# Altium schematic sheet Radar_Sheet1.SchDoc
size 420 x 297 mm; SheetNumber: 4; SheetTotal: 6
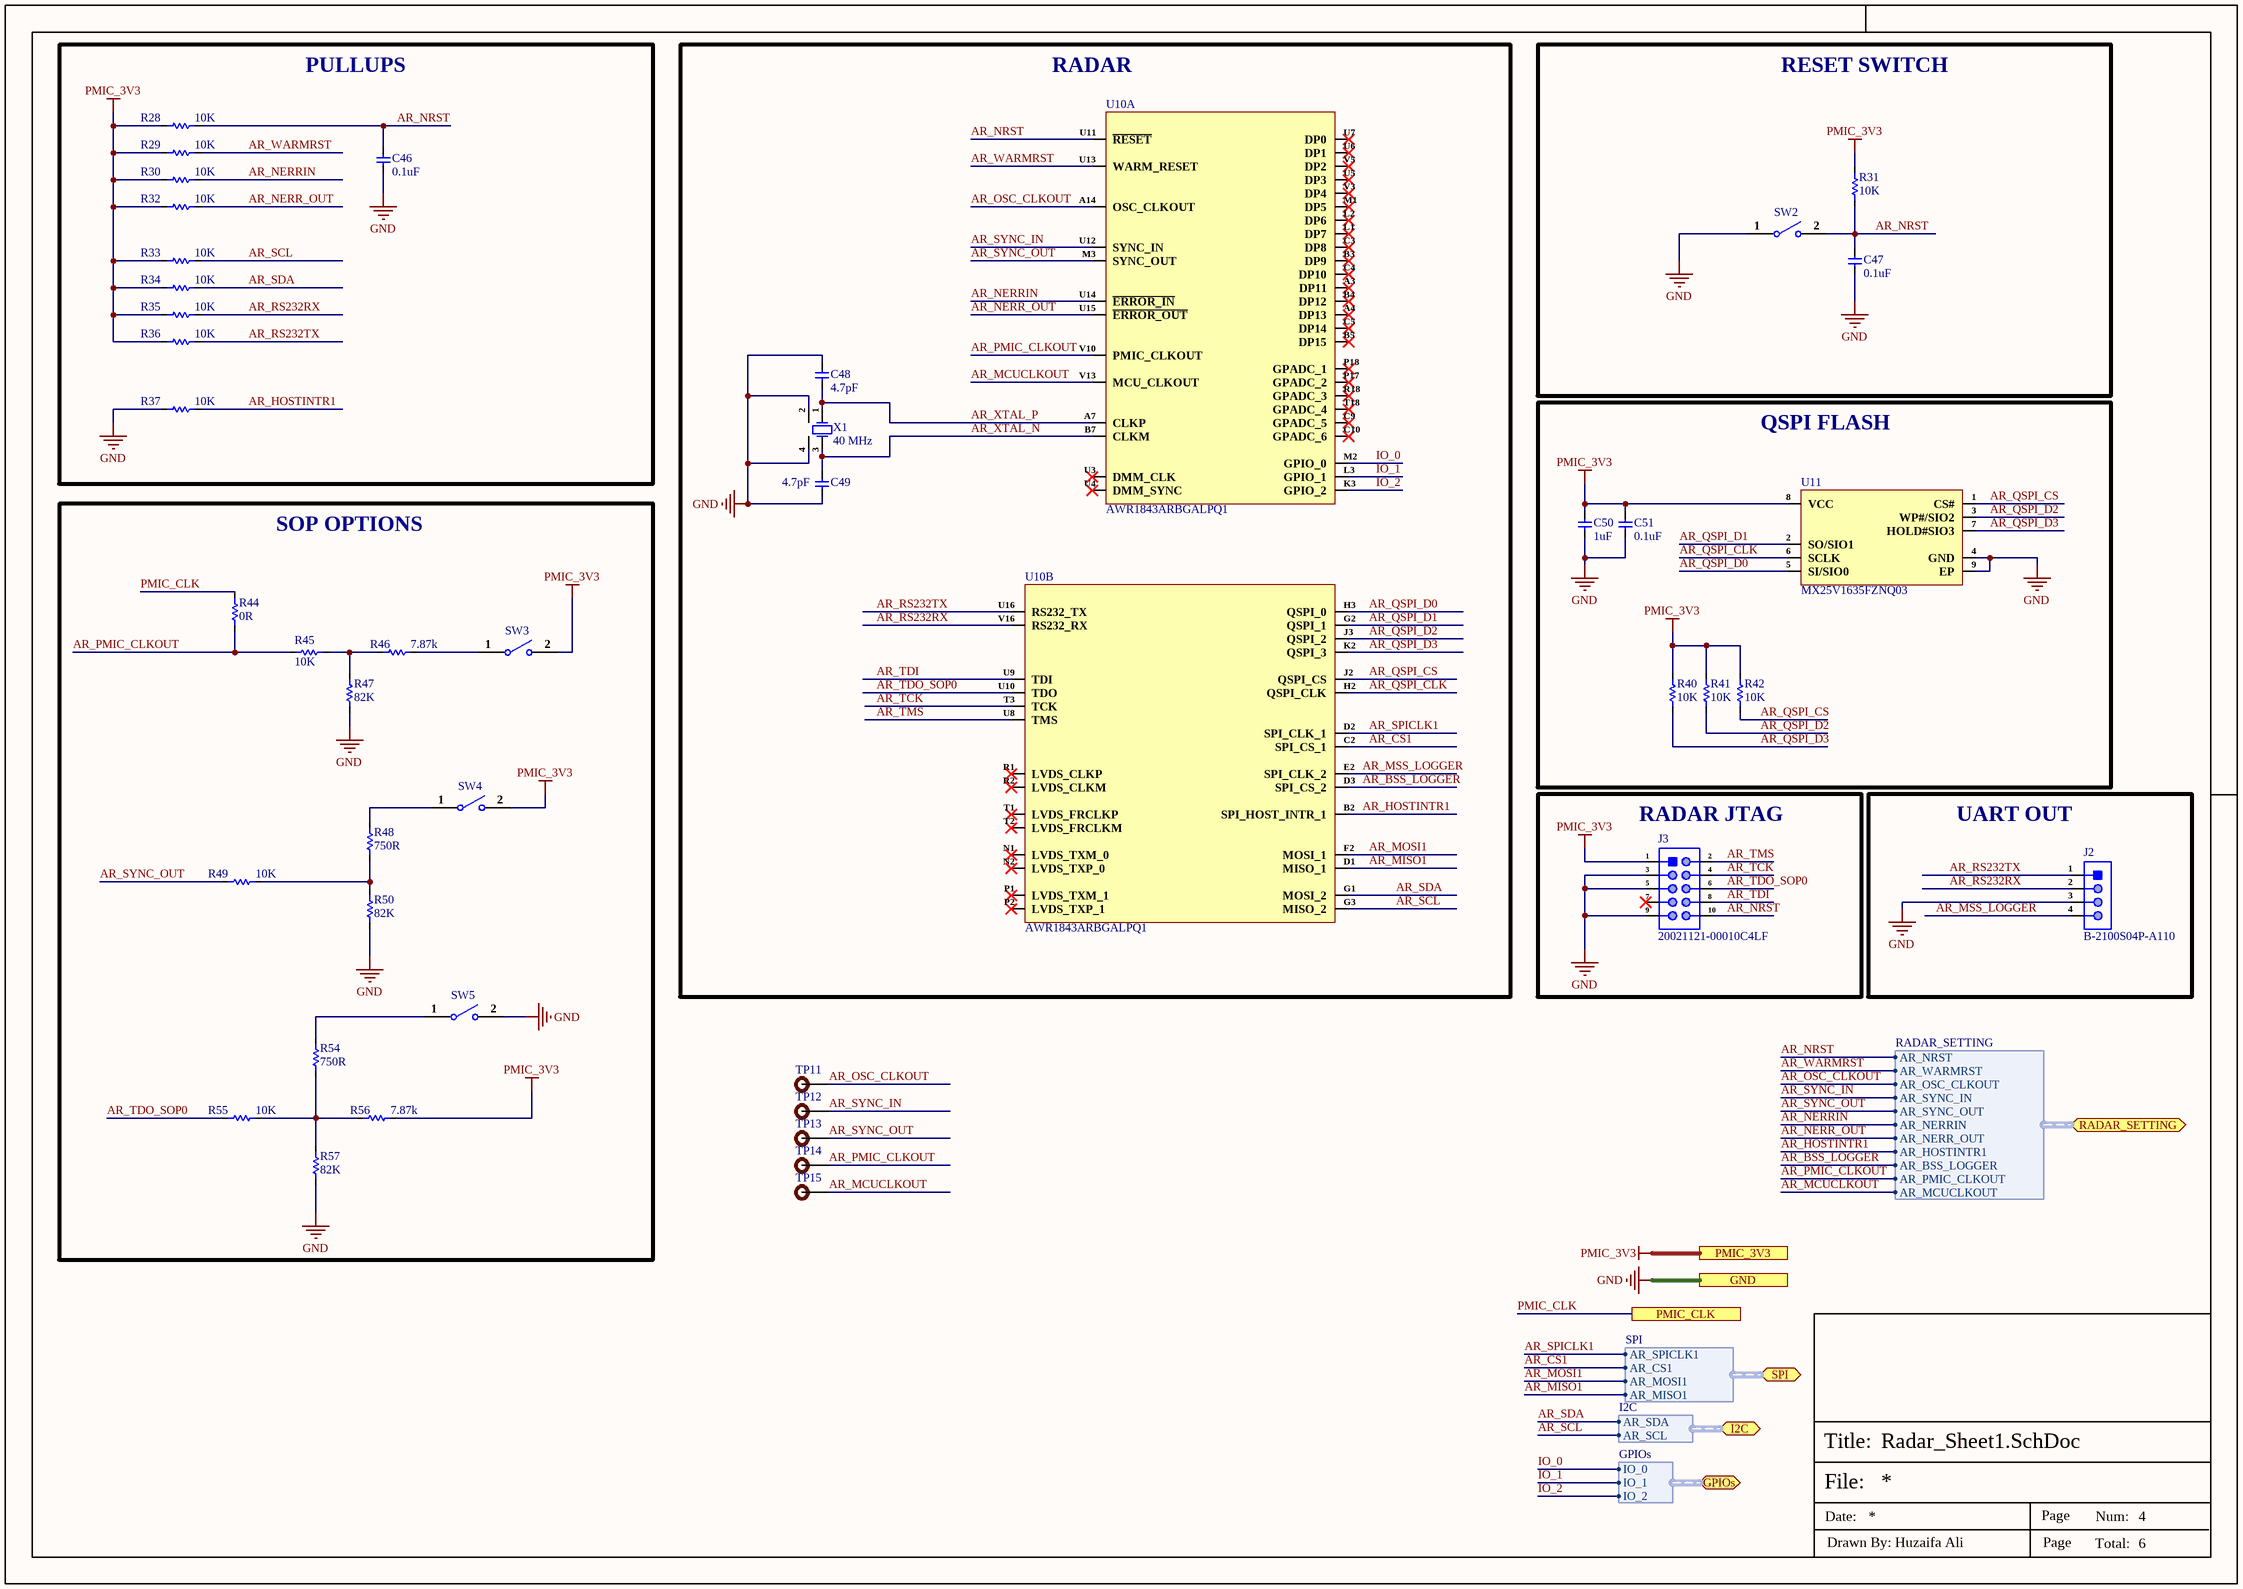
[diagram p0: Radar_Sheet1.SchDoc]

## Parts
C46  0.1uF  [Cap-0402]
C47  0.1uF  [Cap-0402]
C48  4.7pF  [Cap-0402]
C49  4.7pF  [Cap-0402]
C50  1uF  [Cap-0402]
C51  0.1uF  [Cap-0402]
J2  B-2100S04P-A110  [HDR1X4_]
J3  20021121-00010C4LF  [20021121-00010C4LF_]
R28  10K  [Res-0402]
R29  10K  [Res-0402]
R30  10K  [Res-0402]
R31  10K  [Res-0402]
R32  10K  [Res-0402]
R33  10K  [Res-0402]
R34  10K  [Res-0402]
R35  10K  [Res-0402]
R36  10K  [Res-0402]
R37  10K  [Res-0402]
R40  10K  [Res-0402]
R41  10K  [Res-0402]
R42  10K  [Res-0402]
R44  0R  [Res-0402]
R45  10K  [Res-0402]
R46  7.87k  [Res-0201]
R47  82K  [Res-0603]
R48  750R  [RES-0805]
R49  10K  [Res-0402]
R50  82K  [Res-0603]
R54  750R  [RES-0805]
R55  10K  [Res-0402]
R56  7.87k  [Res-0201]
R57  82K  [Res-0603]
SW2  B3U-1000P  [B3U-1000P]  (value not drawn)
SW3  DSIC01LSGET  [DSIC01LSGET]  (value not drawn)
SW4  DSIC01LSGET  [DSIC01LSGET]  (value not drawn)
SW5  DSIC01LSGET  [DSIC01LSGET]  (value not drawn)
TP11  TEST POINT  [Test-point]  (value not drawn)  (no BOM)
TP12  TEST POINT  [Test-point]  (value not drawn)  (no BOM)
TP13  TEST POINT  [Test-point]  (value not drawn)  (no BOM)
TP14  TEST POINT  [Test-point]  (value not drawn)  (no BOM)
TP15  TEST POINT  [Test-point]  (value not drawn)  (no BOM)
U10  AWR1843ARBGALPQ1  [180-FCBGA (15x15)]  (parts A,B of 5)
U11  MX25V1635FZNQ03  [8-WSON 6x5-mm]
X1  40 MHz  [SMD2016-4P]

## Blocks framed on the sheet
PULLUPS: C46 R28-R30 R32-R37
RADAR: C48 C49 U10 X1
RESET SWITCH: C47 R31 SW2
QSPI FLASH: C50 C51 R40-R42 U11
SOP OPTIONS: R44-R50 R54-R57 SW3-SW5
RADAR JTAG: J3
UART OUT: J2

## Ports
GND, GPIOs (bidir, harness GPIOs), I2C (bidir, harness I2C), PMIC_3V3, PMIC_CLK, RADAR_SETTING (bidir, harness RADAR_SETTING), SPI (bidir, harness SPI)

## Harnesses
GPIOs: IO_0, IO_1, IO_2
I2C: AR_SDA, AR_SCL
SPI: AR_SPICLK1, AR_CS1, AR_MOSI1, AR_MISO1
RADAR_SETTING: AR_NRST, AR_WARMRST, AR_OSC_CLKOUT, AR_SYNC_IN, AR_SYNC_OUT, AR_NERRIN, AR_NERR_OUT, AR_HOSTINTR1, AR_BSS_LOGGER, AR_PMIC_CLKOUT, AR_MCUCLKOUT

## Nets
GND: C46.1 C47.1 C48.1 C49.1 C50.1 C51.1 J2.3 J3.3 J3.5 J3.9 R37.2 R47.1 R50.1 R57.1 SW2.1 SW5.2 U11.4(GND) U11.9(EP) X1.2(GND) X1.4(GND) ; port GND
PMIC_3V3: C50.2 C51.2 J3.1 R28.2 R29.2 R30.2 R31.2 R32.2 R33.2 R34.2 R35.2 R36.2 R40.2 R41.2 R42.2 R56.2 SW3.2 SW4.2 U11.8(VCC) ; port PMIC_3V3
AR_BSS_LOGGER: U10.D3(SPI_CS_2) ; port RADAR_SETTING.AR_BSS_LOGGER
AR_CS1: U10.C2(SPI_CS_1) ; port SPI.AR_CS1
AR_HOSTINTR1: R37.1 U10.B2(SPI_HOST_INTR_1) ; port RADAR_SETTING.AR_HOSTINTR1
AR_MCUCLKOUT: TP15.1 U10.V13(MCU_CLKOUT) ; port RADAR_SETTING.AR_MCUCLKOUT
AR_MISO1: U10.D1(MISO_1) ; port SPI.AR_MISO1
AR_MOSI1: U10.F2(MOSI_1) ; port SPI.AR_MOSI1
AR_MSS_LOGGER: J2.4 U10.E2(SPI_CLK_2)
AR_NERR_OUT: R32.1 U10.U15(~{ERROR_OUT}) ; port RADAR_SETTING.AR_NERR_OUT
AR_NERRIN: R30.1 U10.U14(~{ERROR_IN}) ; port RADAR_SETTING.AR_NERRIN
AR_NRST: C46.2 C47.2 J3.10 R28.1 R31.1 SW2.2 U10.U11(~{RESET}) ; port RADAR_SETTING.AR_NRST
AR_OSC_CLKOUT: TP11.1 U10.A14(OSC_CLKOUT) ; port RADAR_SETTING.AR_OSC_CLKOUT
AR_PMIC_CLKOUT: R44.1 R45.2 TP14.1 U10.V10(PMIC_CLKOUT) ; port RADAR_SETTING.AR_PMIC_CLKOUT
AR_QSPI_CLK: U10.H2(QSPI_CLK) U11.6(SCLK)
AR_QSPI_CS: R42.1 U10.J2(QSPI_CS) U11.1(CS#)
AR_QSPI_D0: U10.H3(QSPI_0) U11.5(SI/SIO0)
AR_QSPI_D1: U10.G2(QSPI_1) U11.2(SO/SIO1)
AR_QSPI_D2: R41.1 U10.J3(QSPI_2) U11.3(WP#/SIO2)
AR_QSPI_D3: R40.1 U10.K2(QSPI_3) U11.7(HOLD#SIO3)
AR_RS232RX: J2.2 R35.1 U10.V16(RS232_RX)
AR_RS232TX: J2.1 R36.1 U10.U16(RS232_TX)
AR_SCL: R33.1 U10.G3(MISO_2) ; port I2C.AR_SCL
AR_SDA: R34.1 U10.G1(MOSI_2) ; port I2C.AR_SDA
AR_SPICLK1: U10.D2(SPI_CLK_1) ; port SPI.AR_SPICLK1
AR_SYNC_IN: TP12.1 U10.U12(SYNC_IN) ; port RADAR_SETTING.AR_SYNC_IN
AR_SYNC_OUT: R49.2 TP13.1 U10.M3(SYNC_OUT) ; port RADAR_SETTING.AR_SYNC_OUT
AR_TCK: J3.4 U10.T3(TCK)
AR_TDI: J3.8 U10.U9(TDI)
AR_TDO_SOP0: J3.6 R55.2 U10.U10(TDO)
AR_TMS: J3.2 U10.U8(TMS)
AR_WARMRST: R29.1 U10.U13(WARM_RESET) ; port RADAR_SETTING.AR_WARMRST
AR_XTAL_N: C49.2 U10.B7(CLKM) X1.3(Out/In)
AR_XTAL_P: C48.2 U10.A7(CLKP) X1.1(IN/OUT)
IO_0: U10.M2(GPIO_0) ; port GPIOs.IO_0
IO_1: U10.L3(GPIO_1) ; port GPIOs.IO_1
IO_2: U10.K3(GPIO_2) ; port GPIOs.IO_2
PMIC_CLK: R44.2 ; port PMIC_CLK
NetR45_1: R45.1 R46.1 R47.2
NetR46_2: R46.2 SW3.1
NetR48_1: R48.1 R49.1 R50.2
NetR48_2: R48.2 SW4.1
NetR54_1: R54.1 R55.1 R56.1 R57.2
NetR54_2: R54.2 SW5.1

Not connected (* = marked no-connect by the designer): J3 7*; U10 A3(DP11)* A4(DP13)* B3(DP9)* B4(DP12)* B5(DP15)* C3(DP8)* C4(DP10)* C5(DP14)* C9(GPADC_5)* C10(GPADC_6)* L1(DP7)* L2(DP6)* M1(DP5)* N1(LVDS_TXM_0)* N2(LVDS_TXP_0)* P1(LVDS_TXM_1)* P2(LVDS_TXP_1)* P17(GPADC_2)* P18(GPADC_1)* R1(LVDS_CLKP)* R2(LVDS_CLKM)* R18(GPADC_3)* T1(LVDS_FRCLKP)* T2(LVDS_FRCLKM)* T18(GPADC_4)* U3(DMM_CLK)* U4(DMM_SYNC)* U5(DP3)* U6(DP1)* U7(DP0)* V3(DP4)* V5(DP2)*

## Notes on the sheet
- File:
- Title:
- Date:
- Page
- Num:
- Total:
- Drawn By: Huzaifa Ali

## Library data of the parts
C46 C47 C51 = CC0402JRX7R7BB104: CAP CER 0.1UF 16V X7R 0402; Manufacturer: Yageo; Material: 4241ConductorMaterial; Value: 100nF; Tolerance: 5%; Item Type: Capacitor; Supplier: Digikey; Supplier Part Number: 311-1676-1-ND; Manufacturer Part Number: CC0402JRX7R7BB104; RoHS: Yes; Category: Ceramic Capacitors; Stock: 1659111; Pricing: 1=0.1, 10=0.046, 50=0.0262, 100=0.0203, 500=0.01528, 1000=0.012, 2500=0.01091, 5000=0.01004 (USD); Mounting Technology: Surface Mount; Case/Package: 0402; Case Code (Metric): 1005; Case Code (Imperial): 0402; Min Operating Temperature: -55°C; Max Operating Temperature: 125°C; Dielectric: X7R; Packaging: Tape and Reel; Package Quantity: 10000; Voltage Rating (DC): 16V; Voltage Rating: 16V; Series: CC; Construction: Flat; Length: 0.039inch; Width: 0.02inch; Height: 0.5mm; Thickness: 0.022inch; Lead Free: Lead Free; Halogen Free: Halogen Free; RoHS Compliant: Yes; ComponentLink1URL: https://datasheet.ciiva.com/13210/upy-gphc-x7r-6-3v-to-50v-8-12304-13210152.pdf?src-supplier=Mouser; ComponentLink1Description: https://datasheet.ciiva.com/13210/upy-gphc-x7r-6-3v-to-50v-8-12304-13210152.pdf?src-supplier=Mouser; LCSC Part Number: C541464
C48 C49 = CC0402BRNPO9BN4R7: CAP CER 4.7PF 50V C0G/NPO 0402; Manufacturer: Yageo; Dielectric: C0G; Item Type: Capacitor; Supplier: Future Electronics; Supplier Part Number: 8379141; Manufacturer Part Number: CC0402BRNPO9BN4R7; RoHS: Yes; Category: Ceramic Capacitors; Stock: 80000; Pricing: 10000=0.0031, 40000=0.0029, 150000=0.0027, 250000=0.0027, 500000=0.0025 (USD); Mounting Technology: Surface Mount; Case/Package: 0402; Case Code (Imperial): 0402; Case Code (Metric): 1005; Min Operating Temperature: -55°C; Max Operating Temperature: 125°C; Voltage Rating: 50V; Value: 4.7pF; Packaging: Tape and Reel; Package Quantity: 10000; Voltage Rating (DC): 50V; Termination: SMD/SMT; Series: CC; Length: 1mm; Width: 0.5mm; Depth: 0.5mm; Radiation Hardening: No; Lead Free: Lead Free; RoHS Compliant: Yes; Halogen Free: 5694HalogenFree; ComponentLink1URL: https://datasheet.ciiva.com/11587/upy-gp-np0-16v-to-50v-8-11587134.pdf?src-supplier=Avnet; ComponentLink1Description: https://datasheet.ciiva.com/11587/upy-gp-np0-16v-to-50v-8-11587134.pdf?src-supplier=Avnet; ComponentLink2URL: https://datasheet.ciiva.com/13385/upy-gp-np0-16v-to-50v-8-13385886.pdf?src-supplier=Mouser; ComponentLink2Description: https://datasheet.ciiva.com/13385/upy-gp-np0-16v-to-50v-8-13385886.pdf?src-supplier=Mouser; LCSC Part Number: C325453
C50 = CC0402KRX5R7BB105: CAP CER 1UF 16V X5R 0402; Manufacturer: Yageo; Tolerance: 10%; Item Type: Capacitor; Supplier 1: Digi-Key; Manufacturer Part Number: CC0402KRX5R7BB105; Stock 1: 1405667; Pricing 1: 1=0.36, 10=0.252, 100=0.1512, 500=0.1134, 1000=0.09576, 2500=0.09072, 5000=0.08568 (USD); Mount: Surface Mount; Case/Package: 0402; Weight: 2.3E-05oz; Case Code (Imperial): 0402; Case Code (Metric): 1005; Min Operating Temperature: -55°C; Max Operating Temperature: 85°C; Capacitance: 1uF; Dielectric: X5R; Packaging: Tape and Reel; Voltage Rating (DC): 16V; Voltage Rating: 16V; Termination: SMD/SMT; Composition: Ceramic; Length: 1mm; Height: 0.5mm; Width: 0.02inch; Thickness: 0.022inch; Depth: 0.5mm; Radiation Hardening: No; Lead Free: Lead Free; Halogen Free: Halogen Free; ComponentLink1URL: http://www.yageo.com/documents/recent/UPY-GPHC_X5R_4V-to-50V_12.pdf?src-supplier=Avnet+Europe; ComponentLink1Description: http://www.yageo.com/documents/recent/UPY-GPHC_X5R_4V-to-50V_12.pdf?src-supplier=Avnet+Europe; Supplier Part Number 1: 311-1691-6-ND; LCSC Part Number: C325464
J2 = B-2100S04P-A110: Straight 2.54mm Black Brass 1x4P Plugin,P=2.54mm Pin Headers ROHS; Manufacturer: Ckmtw; Item Type: Header; LCSC Part Number: C124378; Manufacturer Part Number: B-2100S04P-A110; ComponentLink1Description: LCSC; ComponentLink1URL: https://www.lcsc.com/product-detail/Pin-Headers_Ckmtw-Shenzhen-Cankemeng-B-2100S04P-A110_C124378.html
J3 = 20021121-00010C4LF: CONN HEADER SMD 10POS 1.27MM; Manufacturer: Amphenol FCI; Number of Contacts: 10; Contact Resistance: 30mR; Current Rating: 1A; Voltage Rating: 125V; Insulation Resistance: 100MR; Gender: Male; Connector Type: Male Pin,Header; Row Spacing: 0.05inch; Stack Height: 3mm; Item Type: Jtag Male Header; Supplier 1: Digi-Key; Manufacturer Part Number: 20021121-00010C4LF; Stock 1: 0; Pricing 1: 1=0.87, 10=0.761, 100=0.6563 (USD); Mount: Surface Mount; Contact Plating: Gold; Contact Material: Copper Alloy,Copper,Gold; Color: Black; Housing Color: Black; Housing Material: Thermoplastic; Min Operating Temperature: -40°C; Max Operating Temperature: 85°C; Number of Rows: 2; Termination: Solder; Packaging: Tape and Reel; Package Quantity: 600; Number of Positions: 10; Max Voltage Rating (AC): 125V; Orientation: Straight; Length: 6.35mm; Pitch: 1.27mm; Contact Mating Length: 0.12inch; Depth: 3.4mm; Radiation Hardening: No; REACH SVHC: No SVHC; ComponentLink1URL: https://www.verical.com/server-webapp/html/getDatasheet?partID=177140&src-supplier=Verical; ComponentLink1Description: https://www.verical.com/server-webapp/html/getDatasheet?partID=177140&src-supplier=Verical; ComponentLink2URL: http://portal.fciconnect.com/Comergent/fci/drawing/20021121.pdf?src-supplier=Avnet; ComponentLink2Description: http://portal.fciconnect.com/Comergent/fci/drawing/20021121.pdf?src-supplier=Avnet; ComponentLink3URL: https://cdn.amphenol-icc.com/media/wysiwyg/files/drawing/20021121.pdf?src-supplier=Digi-Key; ComponentLink3Description: https://cdn.amphenol-icc.com/media/wysiwyg/files/drawing/20021121.pdf?src-supplier=Digi-Key; ComponentLink4URL: http://portal.fciconnect.com/Comergent/fci/drawing/20021121.pdf?src-supplier=Avnet+Europe; ComponentLink4Description: http://portal.fciconnect.com/Comergent/fci/drawing/20021121.pdf?src-supplier=Avnet+Europe; ComponentLink5URL: https://media.digikey.com/pdf/Data%20Sheets/FCI%20PDFs/Minitek%20127_Catalog.pdf?src-supplier=Digi-Key; ComponentLink5Description: https://media.digikey.com/pdf/Data%20Sheets/FCI%20PDFs/Minitek%20127_Catalog.pdf?src-supplier=Digi-Key; ComponentLink6URL: http://portal.fciconnect.com/Comergent//fci/drawing/20021121.pdf?src-supplier=Mouser; ComponentLink6Description: http://portal.fciconnect.com/Comergent//fci/drawing/20021121.pdf?src-supplier=Mouser; Supplier Part Number 1: 609-3695-6-ND; LCSC Part Number: C150517
R28-R37 R40-R42 R45 R49 R55 = RC0402FR-0710KL: RES 10K OHM 1% 1/16W 0402; Manufacturer: Yageo; Resistance: 10kR; Voltage Rating (DC): 50V; Temperature Coefficient: 100ppm/°C; Power Rating: 62.5mW; Max Power Dissipation: 63mW; Item Type: Resistor; Supplier 1: Mouser; Manufacturer Part Number: RC0402FR-0710KL; RoHS: Yes; Category: Chip SMD Resistors; Stock 1: 18648329; Pricing 1: 1=0.10000, 10=0.01400, 50=0.01400, 100=0.00500, 1000=0.00300, 10000=0.00200 (USD); Case/Package: 0402; Number of Pins: 2; Case Code (Imperial): 0402; Case Code (Metric): 1005; Min Operating Temperature: -55°C; Max Operating Temperature: 155°C; Resistor Type: Thick Film; Tolerance: 1%; Packaging: Tape and Reel; Voltage Rating: 50V; Termination: SMD/SMT; Working Voltage: 50V; Number of Terminations: 2; Features: Moisture Resistant; Series: RC; Resistance Tolerance: 1%; Construction: Rectangular; Length: 1mm; Width: 0.5mm; Height: 0.32mm; Depth: 0.5mm; Lead Pitch: 0.2mm; REACH SVHC: No SVHC; Lead Free: Lead Free; RoHS Compliant: Yes; Military Standard: Not; ComponentLink1URL: https://datasheet.ciiva.com/7660/38568-7660787.pdf?src-supplier=Element14; ComponentLink1Description: https://datasheet.ciiva.com/7660/38568-7660787.pdf?src-supplier=Element14; ComponentLink2URL: https://datasheet.ciiva.com/7849/1686128-7849814.pdf?src-supplier=Element14; ComponentLink2Description: https://datasheet.ciiva.com/7849/1686128-7849814.pdf?src-supplier=Element14; ComponentLink3URL: https://datasheet.ciiva.com/7983/1018594-7983486.pdf?src-supplier=Element14; ComponentLink3Description: https://datasheet.ciiva.com/7983/1018594-7983486.pdf?src-supplier=Element14; ComponentLink4URL: https://datasheet.ciiva.com/22747/1018594-22747512.pdf?src-supplier=Element14; ComponentLink4Description: https://datasheet.ciiva.com/22747/1018594-22747512.pdf?src-supplier=Element14; ComponentLink5URL: https://datasheet.ciiva.com/12667/pyu-rc0402-51-rohs-l-6-r-12667067.pdf?src-supplier=Mouser; ComponentLink5Description: https://datasheet.ciiva.com/12667/pyu-rc0402-51-rohs-l-6-r-12667067.pdf?src-supplier=Mouser; ComponentLink6URL: https://datasheet.ciiva.com/7849/1784430-7849813.pdf?src-supplier=Element14; ComponentLink6Description: https://datasheet.ciiva.com/7849/1784430-7849813.pdf?src-supplier=Element14; ComponentLink7URL: https://datasheet.ciiva.com/7849/1784430-7849815.pdf?src-supplier=Element14; ComponentLink7Description: https://datasheet.ciiva.com/7849/1784430-7849815.pdf?src-supplier=Element14; Supplier Part Number 1: 603-RC0402FR-0710KL; LCSC Part Number: C60490
R44 = RC0402FR-070RL: RES 0 OHM JUMPER 1/16W 0402; Manufacturer: Yageo; Tolerance: 1%; Power Rating: 62.5mW; Voltage Rating: 50V; Temperature Coefficient: 200ppm/°C; Max Power Dissipation: 63mW; Supplier 1: Mouser; Manufacturer Part Number: RC0402FR-070RL; RoHS: Yes; Category: Chip SMD Resistors; Stock 1: 8556842; Pricing 1: 1=0.10000, 10=0.01400, 50=0.01400, 100=0.00600, 1000=0.00300, 5000=0.00200, 10000=0.00100 (USD); Mount: Surface Mount; Case/Package: 0402; Contact Plating: Tin,Matte; Case Code (Imperial): 0402; Case Code (Metric): 1005; Size Code: 0402; Min Operating Temperature: -55°C; Max Operating Temperature: 155°C; Resistance: 0R; Resistor Type: Thick Film; Packaging: Tape and Reel; Termination: SMD/SMT; Features: Moisture Resistant; Series: RC; Number of Terminations: 2; Length: 1mm; Width: 0.5mm; Height: 0.35mm; Radiation Hardening: No; Lead Free: Lead Free; RoHS Compliant: Yes; ComponentLink1URL: https://datasheet.ciiva.com/8896/pyu-rc0402-51-rohs-l-6-8896149.pdf?src-supplier=Avnet; ComponentLink1Description: https://datasheet.ciiva.com/8896/pyu-rc0402-51-rohs-l-6-8896149.pdf?src-supplier=Avnet; ComponentLink2URL: https://datasheet.ciiva.com/16790/pyu-rc0402-51-rohs-l-6-r-16790444.pdf?src-supplier=Future+Electronics; ComponentLink2Description: https://datasheet.ciiva.com/16790/pyu-rc0402-51-rohs-l-6-r-16790444.pdf?src-supplier=Future+Electronics; Supplier Part Number 1: 603-RC0402FR-070RL; LCSC Part Number: C106231
R46 R56 = 0201WMF7871TEE: 50mW Thick Film Resistors ±1% 7.87kΩ 0201 Chip Resistor - Surface Mount ROHS; Manufacturer: UNI-ROYAL(Uniroyal Elec); Manufacturer Part Number: 0201WMF7871TEE; Package: 0201; LCSC Part Number: C473937; Item Type: Resistor; ComponentLink1Description: LCSC; ComponentLink1URL: https://www.lcsc.com/product-detail/Chip-span-style-background-color-ff0-Resistor-span-Surface-Mount_UNI-ROYAL-Uniroyal-Elec-0201WMF7871TEE_C473937.html
R47 R50 R57 = 0603WAD8202T5E: 82kΩ 0603 Chip Resistor - Surface Mount ROHS; Manufacturer: UNI-ROYAL; ComponentLink1Description: LCSC; ComponentLink1URL: https://lcsc.com/product-detail/Chip-span-style-background-color-ff0-Resistor-span-Surface-Mount_UNI-ROYAL-Uniroyal-Elec-0603WAD8202T5E_C407560.html; Manufacturer Part Number: 0603WAD8202T5E; Footprint: 0603; LCSC Part Number: C407560; Item Type: Resistor
R48 R54 = RT0805BRD07750RL: RES SMD 750 OHM 0.1% 1/8W 0805; Manufacturer: Yageo; Power Rating: 125mW; Voltage Rating: 150V; Temperature Coefficient: 25ppm/°C; Item type: Resistor; Supplier 1: Arrow Electronics; Manufacturer Part Number: RT0805BRD07750RL; RoHS: Yes; Category: Chip SMD Resistors; Stock 1: 5653; Pricing 1: 1=0.33450, 10=0.24070, 25=0.22900, 100=0.09650, 250=0.09470, 500=0.06880, 1000=0.04610, 3000=0.03410 (USD); Case/Package: 0805; Case Code (Metric): 2012; Case Code (Imperial): 0805; Weight: 0.000194oz; Contact Plating: Tin,Matte; Min Operating Temperature: -55°C; Max Operating Temperature: 125°C; Package Quantity: 5000; Packaging: Tape and Reel; Resistance: 750R; Tolerance: 0.1%; Resistor Type: Thin Film; Number of Terminations: 2; Termination: SMD/SMT; Max Power Dissipation: 125mW; Voltage Rating (DC): 150V; Series: RT; Construction: Rectangular; Length: 2mm; Width: 0.049inch; Height: 0.024inch; Depth: 1.25mm; Radiation Hardening: No; Military Standard: Not; Lead Free: Lead Free; RoHS Compliant: Yes; ComponentLink1URL: https://datasheet.ciiva.com/2585/pyu-rt-1-to-0-05-rohs-l-5-2585169.pdf?src-supplier=Digi-Key; ComponentLink1Description: https://datasheet.ciiva.com/2585/pyu-rt-1-to-0-05-rohs-l-5-2585169.pdf?src-supplier=Digi-Key; ComponentLink2URL: https://datasheet.ciiva.com/8884/pyu-rt-1-to-0-05-rohs-l-4-8884854.pdf?src-supplier=Avnet; ComponentLink2Description: https://datasheet.ciiva.com/8884/pyu-rt-1-to-0-05-rohs-l-4-8884854.pdf?src-supplier=Avnet; Supplier Part Number 1: RT0805BRD07750RL; LCSC Part Number: C728656
SW2 = B3U-1000P: SWITCH TACTILE SPST-NO 0.05A 12V; Manufacturer: Omron; Mechanical Life: 200000Cycles; Operating Force: 1.5N; Throw Configuration: SPST; Current Rating: 50mA; Contact Resistance: 100mR; Illumination Type: Non-Illuminated,Illuminated; Switch Travel: 0.15mm; Switch Function: Off-Mom; Actuator Type: Standard; Actuator Length: 0.4mm; Ratings: Dust Proof,IP40; ComponentLink1URL: http://www.farnell.com/datasheets/60838.pdf?src-supplier=Farnell; ComponentLink1Description: http://www.farnell.com/datasheets/60838.pdf?src-supplier=Farnell; ComponentLink2URL: http://www.farnell.com/datasheets/60838.pdf?src-supplier=Element14; ComponentLink2Description: http://www.farnell.com/datasheets/60838.pdf?src-supplier=Element14; ComponentLink3URL: https://omronfs.omron.com/en_US/ecb/products/pdf/en-b3u.pdf?src-supplier=Digi-Key; ComponentLink3Description: https://omronfs.omron.com/en_US/ecb/products/pdf/en-b3u.pdf?src-supplier=Digi-Key; ComponentLink4URL: http://www.omron.com/ecb/products/pdf/en-b3u.pdf?src-supplier=Digi-Key; ComponentLink4Description: http://www.omron.com/ecb/products/pdf/en-b3u.pdf?src-supplier=Digi-Key; ComponentLink5URL: https://www.distrelec.biz/Web/Downloads/he/et/B3U_eng_datasheet.pdf?mime=application%2Fpdf&src-supplier=Distrelec; ComponentLink5Description: https://www.distrelec.biz/Web/Downloads/he/et/B3U_eng_datasheet.pdf?mime=application%2Fpdf&src-supplier=Distrelec; ComponentLink6URL: http://www.onlinecomponents.com/productFiles/mf-OM/en-b3u.pdf?src-supplier=Onlinecomponents.com; ComponentLink6Description: http://www.onlinecomponents.com/productFiles/mf-OM/en-b3u.pdf?src-supplier=Onlinecomponents.com; Supplier 1: Digi-Key; Manufacturer Part Number: B3U-1000P; Stock 1: 116454; Pricing 1: 1=1, 10=0.961, 25=0.9064, 50=0.7976, 100=0.7251, 250=0.68888, 500=0.67074, 1000=0.52571 (USD); Mount: Surface Mount; Weight: 0.000776oz; Contact Material: Silver; Min Operating Temperature: -25°C; Max Operating Temperature: 70°C; Packaging: Tape and Reel; Voltage Rating (DC): 12V; Package Quantity: 1; Max Current Rating: 50mA; Termination: SMD/SMT; Orientation: Straight; Max Voltage Rating (DC): 12V; Electrical Life: 200000Cycles; Insulation Resistance: 100MR; Contact Current Rating: 50mA; Length: 4mm; Height: 1.2mm; Depth: 2.5mm; Width: 3mm; REACH SVHC: Unknown; Lead Free: Lead Free; ComponentLink7URL: https://www.verical.com/server-webapp/html/getDatasheet?partID=552554&src-supplier=Verical; ComponentLink7Description: https://www.verical.com/server-webapp/html/getDatasheet?partID=552554&src-supplier=Verical; ComponentLink8URL: http://www.farnell.com/datasheets/1685550.pdf?src-supplier=Element14; ComponentLink8Description: http://www.farnell.com/datasheets/1685550.pdf?src-supplier=Element14; ComponentLink9URL: http://www.farnell.com/datasheets/2610940.pdf?src-supplier=Farnell; ComponentLink9Description: http://www.farnell.com/datasheets/2610940.pdf?src-supplier=Farnell; ComponentLink10URL: https://www.alliedelec.com/m/d/4c8a9ef82804fc3c241a13c1e298fd73.pdf?src-supplier=Allied+Electronics; ComponentLink10Description: https://www.alliedelec.com/m/d/4c8a9ef82804fc3c241a13c1e298fd73.pdf?src-supplier=Allied+Electronics; Supplier Part Number 1: SW1020DKR-ND; LCSC Part Number: C231329; Item Type: Switch
SW3-SW5 = DSIC01LSGET: SPST Black Flat dial, raised type 2.54mm 1 SMD,2.5x6mm DIP Switches ROHS; Manufacturer: DongGuan; Item Type: Switch; Manufacturer Part Number: DSIC01LSGET; Package: SMD,2.5x6mm; LCSC Part Number: C54948; ComponentLink1Description: LCSC; ComponentLink1URL: https://www.lcsc.com/product-detail/DIP-Switches_DongGuan-KINGTEK-Industrial-Co-LTD-DSIC01LSGET_C54948.html
TP11-TP15 = TEST POINT: Test Point ON; Item Type: TEST POINT
U10 = AWR1843ARBGALPQ1: RF System on a Chip - SoC Single-chip 76-GHz to 81-GHz automotive radar sensor integrating antenna on package, DSP and MCU 180-FCCSP -40 to 125; Manufacturer: Texas Instruments; Item Type: IC; Supplier: Mouser; Supplier Part Number: 595-AWR1843ARBGALPQ1; Manufacturer Part Number: AWR1843ARBGALPQ1; RoHS: No; Category: Integrated Circuits (ICs); Stock: 118; Pricing: 1=46.9, 10=43.76, 50=40.61, 100=37.99, 1000=37.99, 10000=37.99 (USD); Case/Package: 107Case; Pins: 180NUMBER; Length: 15mm; Width: 15mm; Height: 965um; Thickness: 965um
U11 = MX25V1635FZNQ03: IC FLASH 16MBIT SPI/QUAD 8WSON; Manufacturer: Macronix; Supplier: Digikey; Supplier Part Number: 1092-MX25V1635FZNQ03-ND; Manufacturer Part Number: MX25V1635FZNQ03; RoHS: No; Category: Flash; Stock: 7952; Pricing: 1=1.12, 10=1.017, 25=0.99, 40=0.98475, 80=0.88038, 230=0.87778, 570=0.86453, 1140=0.82783, 5130=0.77074 (USD); Item Type: IC
X1 = FW4000044Q: Crystal 40.0000MHZ 8PF SMD; Manufacturer: Diodes; Item Type: Crystals; ESR (Equivalent Series Resistance): 50R; Frequency: 40MHz; Tolerance: 0.001%; Supplier: Digikey; Supplier Part Number: FW4000044QDICT-ND; Manufacturer Part Number: FW4000044Q; RoHS: No; Stock: 15600; Pricing: 1=0.76, 10=0.669, 50=0.6254, 100=0.5527, 500=0.52358, 1000=0.43632 (USD); Min Operating Temperature: -40°C; Max Operating Temperature: 125°C; Load Capacitance: 8pF; Height: 550um; ComponentLink1URL: https://www.diodes.com/assets/Datasheets/FW.pdf?src-supplier=Digikey; ComponentLink1Description: https://www.diodes.com/assets/Datasheets/FW.pdf?src-supplier=Digikey